# Altium schematic sheet Peripheral_Section.SchDoc
size A4; DocumentNumber: 4; SheetNumber: 4
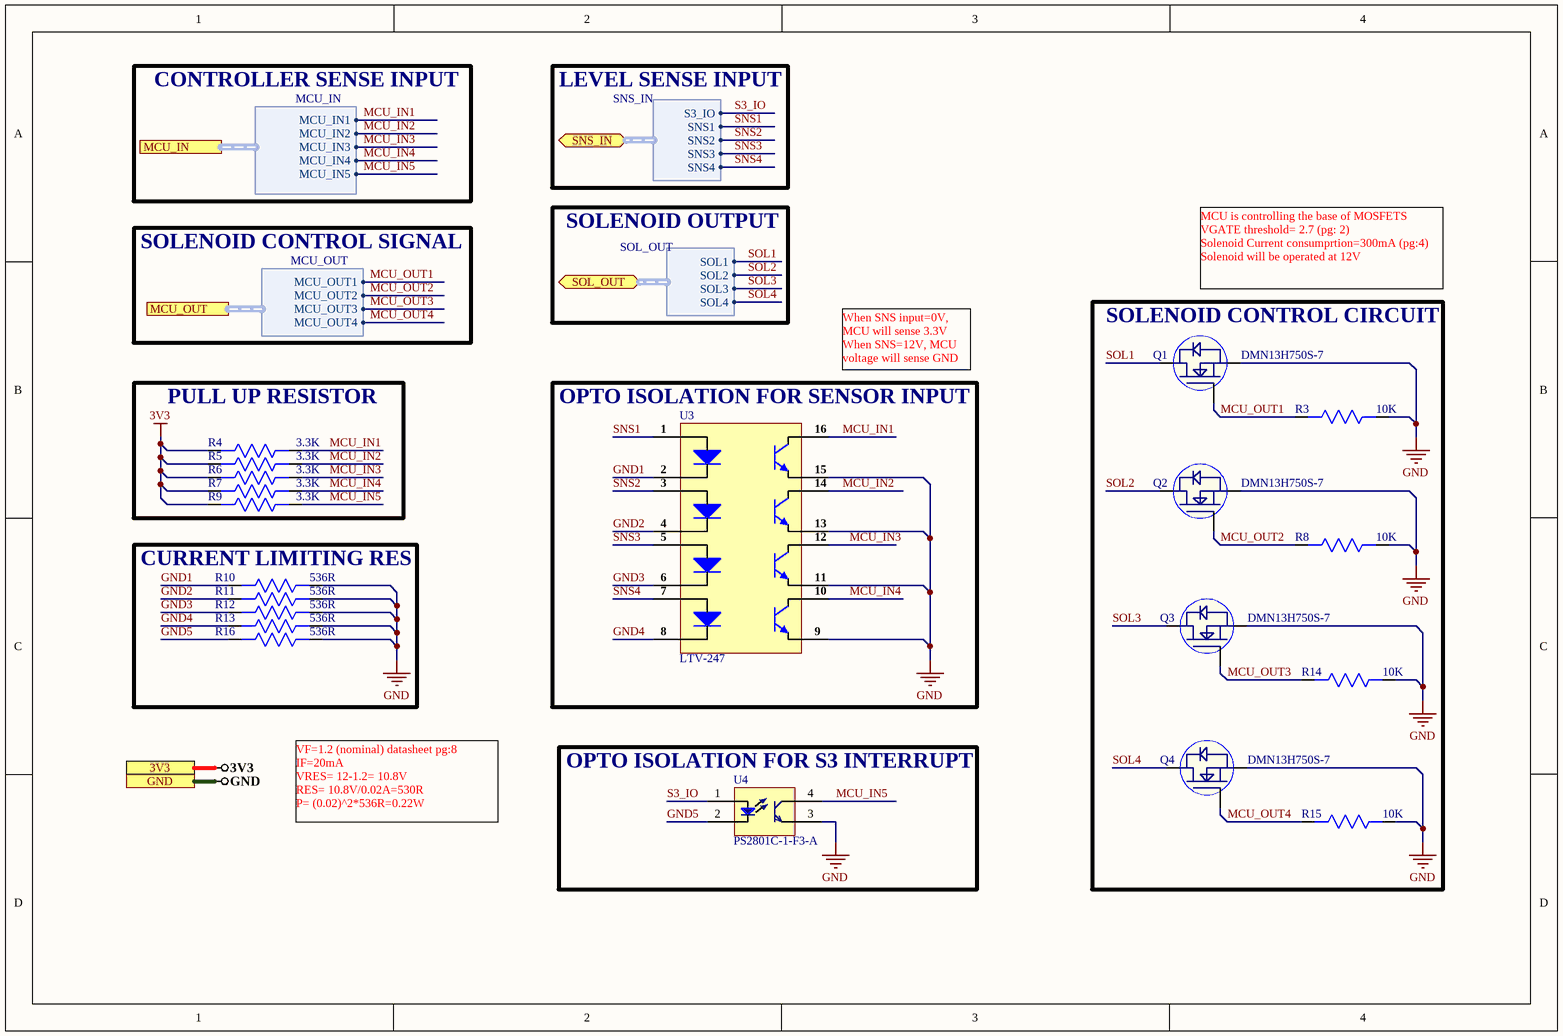
[diagram p0: Peripheral_Section.SchDoc]

## Parts
Q1  DMN13H750S-7  [SOT23-3]
Q2  DMN13H750S-7  [SOT23-3]
Q3  DMN13H750S-7  [SOT23-3]
Q4  DMN13H750S-7  [SOT23-3]
R3  10K  [Res-0201]
R4  3.3K  [RES-0603]
R5  3.3K  [RES-0603]
R6  3.3K  [RES-0603]
R7  3.3K  [RES-0603]
R8  10K  [Res-0201]
R9  3.3K  [RES-0603]
R10  536R  [Res-1206]
R11  536R  [Res-1206]
R12  536R  [Res-1206]
R13  536R  [Res-1206]
R14  10K  [Res-0201]
R15  10K  [Res-0201]
R16  536R  [Res-1206]
U3  LTV-247  [LTV-247]
U4  PS2801C-1-F3-A  [PS2801C-1-F3-A]

## Blocks framed on the sheet
SOLENOID CONTROL CIRCUIT: Q1-Q4 R3 R8 R14 R15
PULL UP RESISTOR: R4-R7 R9
OPTO ISOLATION FOR SENSOR INPUT: U3
CURRENT LIMITING RES: R10-R13 R16
OPTO ISOLATION FOR S3 INTERRUPT: U4

## Ports
3V3, GND, MCU_IN (harness MCU_IN), MCU_OUT (harness MCU_OUT), SNS_IN (bidir, harness SNS_IN), SOL_OUT (bidir, harness SOL_OUT)

## Harnesses
MCU_IN: MCU_IN1, MCU_IN2, MCU_IN3, MCU_IN4, MCU_IN5
MCU_OUT: MCU_OUT1, MCU_OUT2, MCU_OUT3, MCU_OUT4
SNS_IN: S3_IO, SNS1, SNS2, SNS3, SNS4
SOL_OUT: SOL1, SOL2, SOL3, SOL4

## Nets
3V3: R4.2 R5.2 R6.2 R7.2 R9.2 ; port 3V3
GND: Q1.2(S) Q2.2(S) Q3.2(S) Q4.2(S) R3.1 R8.1 R10.1 R11.1 R12.1 R13.1 R14.1 R15.1 R16.1 U3.9(E) U3.11(E) U3.13(E) U3.15(E) U4.3(E) ; port GND
GND1: R10.2 U3.2(K)
GND2: R11.2 U3.4(K)
GND3: R12.2 U3.6(K)
GND4: R13.2 U3.8(K)
GND5: R16.2 U4.2(Ca)
MCU_IN1: R4.1 U3.16(C) ; port MCU_IN.MCU_IN1
MCU_IN2: R5.1 U3.14(C) ; port MCU_IN.MCU_IN2
MCU_IN3: R6.1 U3.12(C) ; port MCU_IN.MCU_IN3
MCU_IN4: R7.1 U3.10(C) ; port MCU_IN.MCU_IN4
MCU_IN5: R9.1 U4.4(C) ; port MCU_IN.MCU_IN5
MCU_OUT1: Q1.1(G) R3.2 ; port MCU_OUT.MCU_OUT1
MCU_OUT2: Q2.1(G) R8.2 ; port MCU_OUT.MCU_OUT2
MCU_OUT3: Q3.1(G) R14.2 ; port MCU_OUT.MCU_OUT3
MCU_OUT4: Q4.1(G) R15.2 ; port MCU_OUT.MCU_OUT4
S3_IO: U4.1(An) ; port SNS_IN.S3_IO
SNS1: U3.1(A) ; port SNS_IN.SNS1
SNS2: U3.3(A) ; port SNS_IN.SNS2
SNS3: U3.5(A) ; port SNS_IN.SNS3
SNS4: U3.7(A) ; port SNS_IN.SNS4
SOL1: Q1.3(D) ; port SOL_OUT.SOL1
SOL2: Q2.3(D) ; port SOL_OUT.SOL2
SOL3: Q3.3(D) ; port SOL_OUT.SOL3
SOL4: Q4.3(D) ; port SOL_OUT.SOL4

## Notes on the sheet
- CONTROLLER SENSE INPUT
- LEVEL SENSE INPUT
- SOLENOID CONTROL SIGNAL
- SOLENOID OUTPUT
- MCU is controlling the base of MOSFETS
  VGATE threshold= 2.7 (pg: 2)
  Solenoid Current consumprtion=300mA (pg:4)
  Solenoid will be operated at 12V
- When SNS input=0V, MCU will sense 3.3V
  When SNS=12V, MCU voltage will sense GND
- VF=1.2 (nominal) datasheet pg:8
  IF=20mA
  VRES= 12-1.2= 10.8V
  RES= 10.8V/0.02A=530R
  P= (0.02)^2*536R=0.22W

## Library data of the parts
Q1-Q4 = DMN13H750S-7: MOSFET N-CH 130V 1A SOT23; Manufacturer: Diodes; Rds On Max: 750mR; Input Capacitance: 231pF; Max Power Dissipation: 770mW; Supplier 1: Digi-Key; Manufacturer Part Number: DMN13H750S-7; Stock 1: 5815; Pricing 1: 1=0.53, 10=0.455, 25=0.4244, 100=0.3151, 250=0.29936, 500=0.24604, 1000=0.19998 (USD); Mount: Surface Mount; Case/Package: TO-236-3; Min Operating Temperature: -55°C; Max Operating Temperature: 150°C; Packaging: Tape and Reel; Drain to Source Voltage (Vdss): 130V; Continuous Drain Current (ID): 1A; ComponentLink1URL: https://www.diodes.com/assets/Datasheets/DMN13H750S.pdf?src-supplier=Digi-Key; ComponentLink1Description: https://www.diodes.com/assets/Datasheets/DMN13H750S.pdf?src-supplier=Digi-Key; ComponentLink2URL: http://www.mouser.com/ds/2/115/DMN13H750S-526254.pdf?src-supplier=Mouser; ComponentLink2Description: http://www.mouser.com/ds/2/115/DMN13H750S-526254.pdf?src-supplier=Mouser; Supplier Part Number 1: DMN13H750S-7DICT-ND
R3 R8 R14 R15 = RC0201FR-0710KL: RES SMD 10K OHM 1% 1/20W 0201; Manufacturer: Yageo; Resistance: 10kR; Temperature Coefficient: 200ppm/°C; Power Rating: 50mW; Voltage Rating: 25V; Supplier 1: Digi-Key; Manufacturer Part Number: RC0201FR-0710KL; Stock 1: 12729696; Pricing 1: 1=0.1, 10=0.042, 100=0.0171, 1000=0.00768, 2500=0.00666, 5000=0.00551 (USD); Case/Package: 0201; Number of Pins: 2; Weight: 6E-06oz; Contact Plating: Tin,Matte; Case Code (Imperial): 0201; Case Code (Metric): 0603; Min Operating Temperature: -55°C; Max Operating Temperature: 125°C; Tolerance: 1%; Composition: Thick Film; Packaging: Tape and Reel; Package Quantity: 1; Termination: SMD/SMT; Number of Terminations: 2; Military Standard: Not; Max Power Dissipation: 50mW; Voltage Rating (DC): 25V; Working Voltage: 25V; Features: Moisture Resistant; Length: 0.6mm; Height: 0.01inch; Width: 0.3mm; Depth: 0.3mm; Radiation Hardening: No; REACH SVHC: No SVHC; Lead Free: Lead Free; ComponentLink1URL: http://www.yageo.com/documents/recent/PYu-RC_Group_51_RoHS_L_10.pdf?src-supplier=Digi-Key; ComponentLink1Description: http://www.yageo.com/documents/recent/PYu-RC_Group_51_RoHS_L_10.pdf?src-supplier=Digi-Key; ComponentLink2URL: http://www.farnell.com/datasheets/2167052.pdf?src-supplier=Element14; ComponentLink2Description: http://www.farnell.com/datasheets/2167052.pdf?src-supplier=Element14; ComponentLink3URL: http://www.yageo.com/documents/recent/PYu-RC0201_51_RoHS_L_8.pdf?src-supplier=Avnet; ComponentLink3Description: http://www.yageo.com/documents/recent/PYu-RC0201_51_RoHS_L_8.pdf?src-supplier=Avnet; ComponentLink4URL: http://www.yageo.com/documents/recent/PYu-RC0201_51_RoHS_L_8.pdf?src-supplier=Avnet+Europe; ComponentLink4Description: http://www.yageo.com/documents/recent/PYu-RC0201_51_RoHS_L_8.pdf?src-supplier=Avnet+Europe; ComponentLink5URL: https://www.verical.com/server-webapp/html/getDatasheet?partID=421074&src-supplier=Verical; ComponentLink5Description: https://www.verical.com/server-webapp/html/getDatasheet?partID=421074&src-supplier=Verical; ComponentLink6URL: http://www.farnell.com/datasheets/1421516.pdf?src-supplier=Element14; ComponentLink6Description: http://www.farnell.com/datasheets/1421516.pdf?src-supplier=Element14; Supplier Part Number 1: 311-10.0KMCT-ND
R4-R7 R9 = RC0603FR-073K3L: RES SMD 3.3K OHM 1% 1/10W 0603; Manufacturer: Yageo Phycomp; Temperature Coefficient: 100ppm/°C; Resistance: 3.3kR; Voltage Rating (DC): 50V; Power Rating: 100mW; Supplier 1: Digi-Key; Manufacturer Part Number: RC0603FR-073K3L; Stock 1: 6863000; Pricing 1: 1=0.1, 10=0.024, 100=0.0097, 1000=0.00437, 2500=0.00379 (USD); Mount: Surface Mount; Case/Package: 0603; Number of Pins: 2; Min Operating Temperature: -55°C; Max Operating Temperature: 155°C; Tolerance: 1%; Packaging: Cut Tape; Length: 1.6mm; Height: 0.45mm; Width: 800um; Depth: 0.8mm; REACH SVHC: No SVHC; Lead Free: Lead Free; Supplier Part Number 1: 311-3.30KHRCT-ND
R10-R13 = AC1206FR-07536RL: Chip Resistor Automotive Grade Thick Film 1206 536Ohm 1% Paper T/R; Manufacturer: Yageo; Max Power Dissipation: 250mW; Temperature Coefficient: 100ppm/°C; Supplier 1: Avnet; Manufacturer Part Number: AC1206FR-07536RL; RoHS: Yes; Category: Chip SMD Resistors; Pricing 1: 5000=0.00554, 10000=0.00547, 20000=0.00531 (USD); Case/Package: 1206; Min Operating Temperature: -55°C; Max Operating Temperature: 155°C; Packaging: Tape and Reel; Resistance: 536R; Resistor Type: Thick Film; Number of Terminations: 2; Tolerance: 1%; Features: Moisture Resistant,Automotive AEC-Q200; Length: 0.122inch; Width: 0.063inch; Height: 0.026inch; RoHS Compliant: Yes; ComponentLink1URL: http://www.yageo.com/NewPortal/yageodocoutput?fileName=/pdf/R-Chip/PYu-AC_51_RoHS_L_6.pdf&src-supplier=Digi-Key; ComponentLink1Description: http://www.yageo.com/NewPortal/yageodocoutput?fileName=/pdf/R-Chip/PYu-AC_51_RoHS_L_6.pdf&src-supplier=Digi-Key; Supplier Part Number 1: AC1206FR-07536RL
R16 = AC1206FR-07536RL: RES SMD 1206 536Ohm 1% Paper T/R; Manufacturer: Yageo; Max Power Dissipation: 250mW; Temperature Coefficient: 100ppm/°C; Supplier 1: Avnet; Manufacturer Part Number: AC1206FR-07536RL; RoHS: Yes; Category: Chip SMD Resistors; Pricing 1: 5000=0.00554, 10000=0.00547, 20000=0.00531 (USD); Case/Package: 1206; Min Operating Temperature: -55°C; Max Operating Temperature: 155°C; Packaging: Tape and Reel; Resistance: 536R; Resistor Type: Thick Film; Number of Terminations: 2; Tolerance: 1%; Features: Moisture Resistant,Automotive AEC-Q200; Length: 0.122inch; Width: 0.063inch; Height: 0.026inch; RoHS Compliant: Yes; ComponentLink1URL: http://www.yageo.com/NewPortal/yageodocoutput?fileName=/pdf/R-Chip/PYu-AC_51_RoHS_L_6.pdf&src-supplier=Digi-Key; ComponentLink1Description: http://www.yageo.com/NewPortal/yageodocoutput?fileName=/pdf/R-Chip/PYu-AC_51_RoHS_L_6.pdf&src-supplier=Digi-Key; Supplier Part Number 1: AC1206FR-07536RL
U3 = LTV-247: OPTOISO 3.75KV 4CH TRANS 16SO; Manufacturer: Vishay Lite-On; Number of Channels: 4; Collector Emitter Voltage (VCEO): 80V; Reverse Breakdown Voltage: 6V; Forward Voltage: 1.2V; Forward Current: 20mA; Max Power Dissipation: 200mW; Output Current per Channel: 50mA; Collector Emitter Saturation Voltage: 400mV; Power Dissipation: 170mW; Current Transfer Ratio: 600%; Supplier 1: Future Electronics; Manufacturer Part Number: LTV-247; RoHS: Yes; Category: Optocouplers; Stock 1: 178000; Pricing 1: 2000=0.77000 (USD); Mount: Surface Mount; Case/Package: SMD/SMT; Number of Pins: 16; Min Operating Temperature: -55°C; Max Operating Temperature: 110°C; Package Quantity: 2000; Packaging: Tape and Reel; Max Output Voltage: 80V; Max Collector Current: 50mA; Number of Elements: 4; Max Input Current: 50mA; Radiation Hardening: No; RoHS Compliant: Yes; ComponentLink1URL: https://datasheet.ciiva.com/24015/ltv-247-256860-24015561.pdf?src-supplier=Mouser; ComponentLink1Description: https://datasheet.ciiva.com/24015/ltv-247-256860-24015561.pdf?src-supplier=Mouser; ComponentLink2URL: https://datasheet.ciiva.com/29730/ltv-214-244-29730320.pdf?src-supplier=Digi-Key; ComponentLink2Description: https://datasheet.ciiva.com/29730/ltv-214-244-29730320.pdf?src-supplier=Digi-Key; Supplier Part Number 1: 3051235
U4 = PS2801C-1-F3-A: TransistorOptocouplers DC 1 2500Vrms SOP-4_P1.27 Optocouplers RoHS; Manufacturer: CEL; Number of Channels: 1; Collector Emitter Voltage (VCEO): 300mV; Forward Voltage: 1.2V; Max Power Dissipation: 120mW; Max Collector Current: 30mA; Max Output Voltage: 80V; Supplier 1: Digi-Key; Manufacturer Part Number: PS2801C-1-F3-A; Stock 1: 399; Pricing 1: 1=0.77, 10=0.595, 100=0.3825 (USD); Mount: Surface Mount; Case/Package: SOIC; Number of Pins: 4; Min Operating Temperature: -55°C; Max Operating Temperature: 100°C; Packaging: Tape and Reel; Collector Emitter Saturation Voltage: 300mV; Package Quantity: 1; Output Current per Channel: 30mA; Lead Free: Lead Free; ComponentLink1URL: http://www.cel.com/pdf/datasheets/PS2801C-1,PS2801C-4.pdf?src-supplier=Digi-Key; ComponentLink1Description: http://www.cel.com/pdf/datasheets/PS2801C-1,PS2801C-4.pdf?src-supplier=Digi-Key; ComponentLink2URL: http://www.cel.com/pdf/datasheets/how_to_order_optos.pdf?src-supplier=Digi-Key; ComponentLink2Description: http://www.cel.com/pdf/datasheets/how_to_order_optos.pdf?src-supplier=Digi-Key; ComponentLink3URL: http://datasheet.iiic.cc/cel/PS2801C-1-F3-A.pdf?src-supplier=IIIC; ComponentLink3Description: http://datasheet.iiic.cc/cel/PS2801C-1-F3-A.pdf?src-supplier=IIIC; Supplier Part Number 1: PS2801C-1-F3-ACT-ND